# EasyEDA Pro project 前端输入.eprj

# Schematic Schematic1
Board Name: Board1; Create Date: 2026-07-05; Page Name: P1; Project Name: 前端输入; Schematic Name: Schematic1; Update Date: 2026-07-07; Company: 嘉立创EDA; Page Size: A4; Version: V1.0
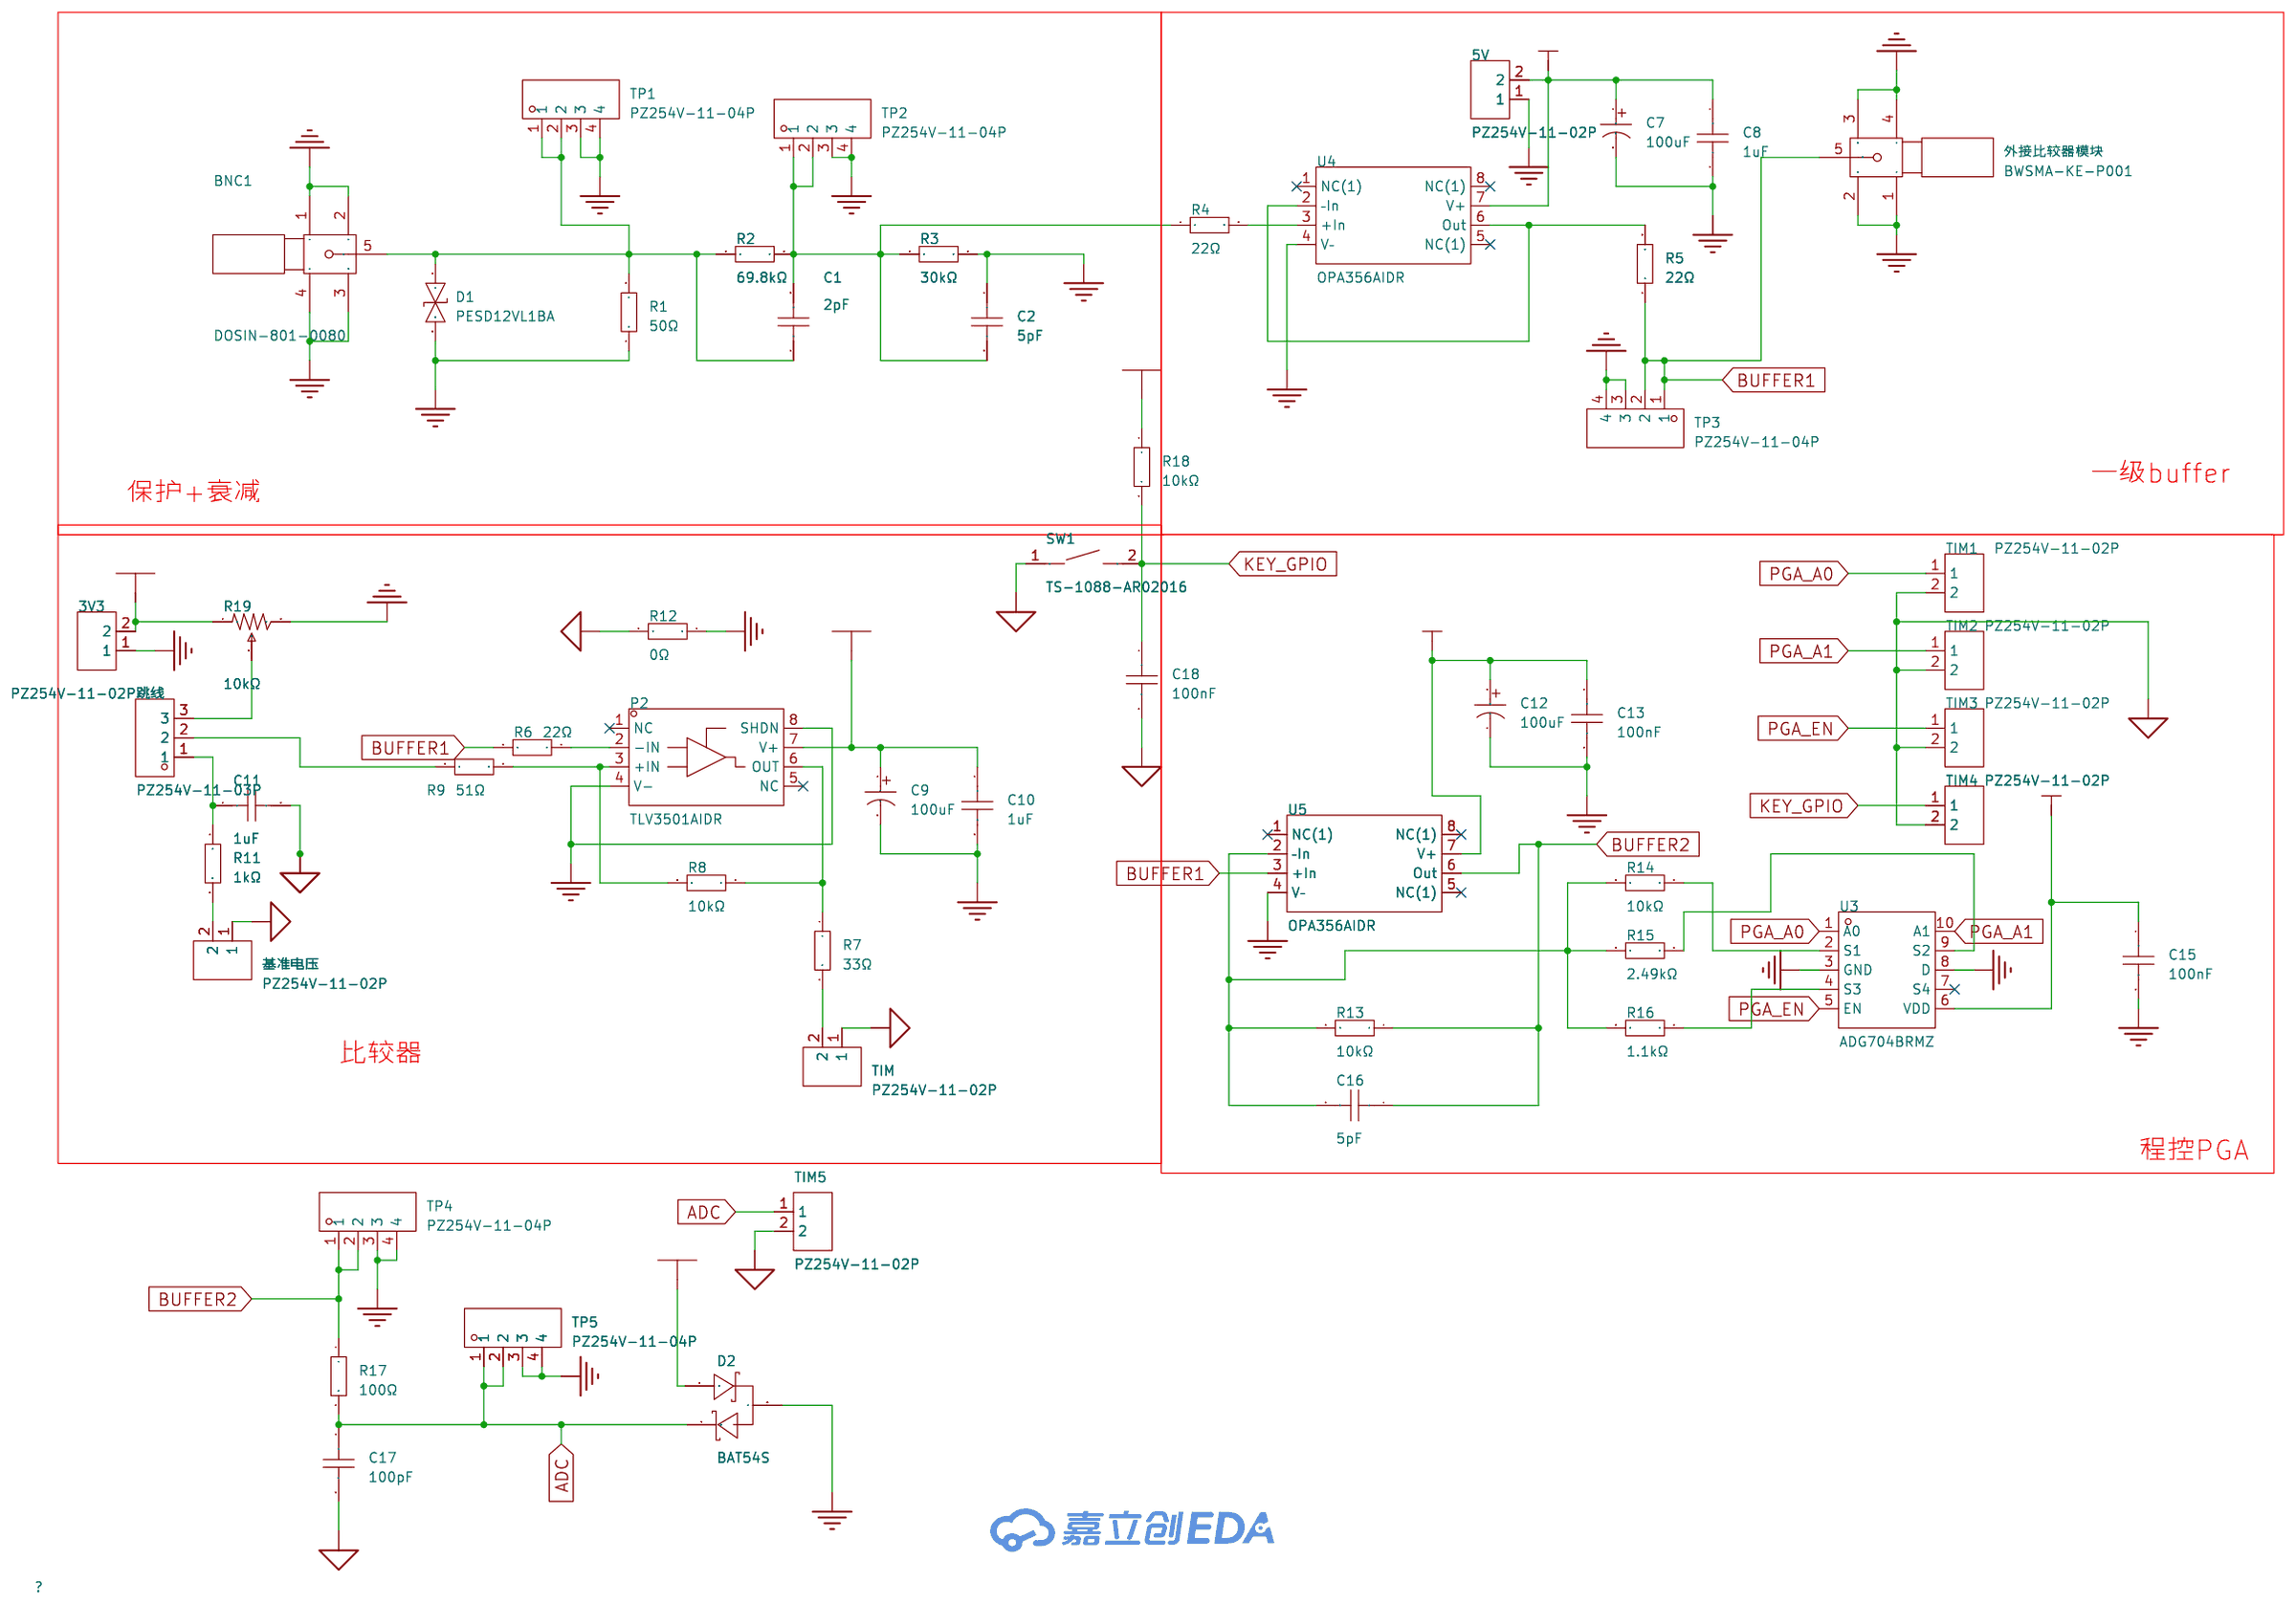
[diagram p0: schematic sheet]

## Parts
3V3  PZ254V-11-02P  [HDR-TH_2P-P2.54-V-M]
5V  PZ254V-11-02P  [HDR-TH_2P-P2.54-V-M]
BNC1  DOSIN-801-0080  [BNC-TH_DOSIN-801-0080]
C1  2pF  [C0603]
C2  5pF  [C0603]
C7  100uF  [CAP-TH_BD6.3-P2.50-D1.0-FD]
C8  1uF  [C0805]
C9  100uF  [CAP-TH_BD6.3-P2.50-D1.0-FD]
C10  1uF  [C0805]
C11  1uF  [C0805]
C12  100uF  [CAP-TH_BD6.3-P2.50-D1.0-FD]
C13  100nF  [C0603]
C15  100nF  [C0603]
C16  5pF  [C0603]
C17  100pF  [C0603]
C18  100nF  [C0603]
D1  PESD12VL1BA  [SOD-323_L1.8-W1.3-LS2.5-BI]
D2  BAT54S  [SOT-23-3_L2.9-W1.3-P1.90-LS2.4-BR]
P2  TLV3501AIDR  [SOP-8_L4.9-W3.9-P1.27-LS6.0-BL]
R1  50Ω  [R0805]
R2  69.8kΩ  [R0603]
R3  30kΩ  [R0805]
R4  22Ω  [R0805]
R5  22Ω  [R0805]
R6  22Ω  [R0805]
R7  33Ω  [R0805]
R8  10kΩ  [R0805]
R9  51Ω  [R0805]
R11  1kΩ  [R0805]
R12  0Ω  [R0805]
R13  10kΩ  [R0603]
R14  10kΩ  [R0603]
R15  2.49kΩ  [R0603]
R16  1.1kΩ  [R0603]
R17  100Ω  [R0805]
R18  10kΩ  [R0805]
R19  10kΩ  [RES-ADJ-TH_3296W]
SW1  TS-1088-AR02016  [SW-SMD_L3.9-W3.0-P4.45]
TIM  PZ254V-11-02P  [HDR-TH_2P-P2.54-V-M]
TIM1  PZ254V-11-02P  [HDR-TH_2P-P2.54-V-M]
TIM2  PZ254V-11-02P  [HDR-TH_2P-P2.54-V-M]
TIM3  PZ254V-11-02P  [HDR-TH_2P-P2.54-V-M]
TIM4  PZ254V-11-02P  [HDR-TH_2P-P2.54-V-M]
TIM5  PZ254V-11-02P  [HDR-TH_2P-P2.54-V-M]
TP1  PZ254V-11-04P  [HDR-TH_4P-P2.54-V-M]
TP2  PZ254V-11-04P  [HDR-TH_4P-P2.54-V-M]
TP3  PZ254V-11-04P  [HDR-TH_4P-P2.54-V-M]
TP4  PZ254V-11-04P  [HDR-TH_4P-P2.54-V-M]
TP5  PZ254V-11-04P  [HDR-TH_4P-P2.54-V-M]
U3  ADG704BRMZ  [MSOP-10_L3.0-W3.0-P0.50-LS5.0-BL]
U4  OPA356AIDR  [SOIC-8_L4.9-W3.9-P1.27-LS6.0-BL]
U5  OPA356AIDR  [SOIC-8_L4.9-W3.9-P1.27-LS6.0-BL]
基准电压  PZ254V-11-02P  [HDR-TH_2P-P2.54-V-M]
外接比较器模块  BWSMA-KE-P001  [SMA-SMD_BWSMA-KE-P001]
跳线  PZ254V-11-03P  [HDR-TH_3P-P2.54-V-M]

## Library data of the parts
3V3 5V TIM TIM1-TIM5 基准电压 = PZ254V-11-02P: 插针结构:1x2P;间距:2.54mm;行距:-;圆针/方针:方针;安装方式:直插;排数:单排;总PIN位数:2P;额定电流:-;额定电压:-;配合针长度:6mm;塑高:2.5mm;端接针长度:3mm;触头材质:黄铜;触头镀层:-;工作温度:-40℃~+105℃;颜色:黑色;; LCSC Part Name: 1x2P 间距:2.54mm 方针 直插; Supplier Part: C492401; Manufacturer: XFCN(兴飞); Supplier Footprint: 插件,P=2.54mm; JLCPCB Part Class: Extended Part; Datasheet: https://item.szlcsc.com/datasheet/PZ254V-11-02P/502957.html; Supplier: LCSC; Pin Structure: 1x2P; Pitch: 2.54mm; Circluar Pins/Square Pins: 方针; Mounting Type: 直插; Number of Rows: 单排; Number of Pins: 2P; Length of Mating Pin: 6mm; Insulation Height: 2.5mm; Length of End Connection Pin: 3mm; Contact Material: 黄铜; Operating Temperature: -40℃~+105℃; Color: 黑色
BNC1 = DOSIN-801-0080: LCSC Part Name: BNC 弯头 三件套; Supplier Part: C521219; Manufacturer: dosinconn(德索五金); Supplier Footprint: 插件; JLCPCB Part Class: Extended Part; Datasheet: https://atta.szlcsc.com/upload/public/pdf/source/20200430/C521219_5C4E877D51B90C03551900B0F93D68EB.pdf; Supplier: LCSC; Connector Type: 板端; RF Series: BNC; Number of Ports: 1; Impedance: 50Ω; Frequency-Max: 3GHz; Style: 弯头; Interface Diameter: 9.6mm; Operating Temperature Range: -55℃~+155℃
C1 = CC0603BRNPO9BN2R0: LCSC Part Name: 2pF 50V ±0.1pF; Supplier Part: C513620; Manufacturer: YAGEO(国巨); Supplier Footprint: 0603; JLCPCB Part Class: Extended Part; Datasheet: https://atta.szlcsc.com/upload/public/pdf/source/20200415/C513620_0748197A58AC495A6AB94E162B9F264B.pdf; Supplier: LCSC; Voltage Rated: 50V; Temperature Coefficient: NP0
C2 C16 = FCC0603N5R0C500CT: LCSC Part Name: ±0.25pF 5pF 50V; Supplier Part: C5137626; Manufacturer: FOJAN(富捷); Supplier Footprint: 0603; JLCPCB Part Class: Extended Part; Datasheet: https://item.szlcsc.com/datasheet/FCC0603N5R0C500CT/5747078.html; Supplier: LCSC; Voltage Rating: 50V; Temperature Coefficient: C0G
C7 C9 C12 = SPZ1EM101E08O00RAXXX: 类型:-;容值:100uF;精度:±20%;额定电压:25V;电容体直径:6.3mm;电容体长度:8mm;脚间距:2.5mm;纹波电流:2.2A@100kHz;等效串联电阻:30mΩ@100kHz;工作寿命:2000hrs@105℃;工作温度:-55℃~+105℃;; LCSC Part Name: 100uF ±20% 25V; Supplier Part: C119026; Manufacturer: AISHI(艾华集团); Supplier Footprint: 径向引线,6.3x8mm; JLCPCB Part Class: Extended Part; Datasheet: https://atta.szlcsc.com/upload/public/pdf/source/20170721/C119026_1500619271504834027.pdf; Supplier: LCSC; Tolerance: ±20%; Rated Voltage: 25V; φD: 6.3mm; L: 8mm; Lead Spacing: 2.5mm; Ripple Current: 2.2A@100kHz; Equivalent Series Resistance(ESR): 30mΩ@100kHz; Lifetime @ Temp: 2000hrs@105℃; Operating Temperature: -55℃~+105℃
C8 C10 C11 = CL21B105KBFNNNE: LCSC Part Name: 1uF ±10% 50V; Supplier Part: C28323; Manufacturer: SAMSUNG(三星); Supplier Footprint: 0805; JLCPCB Part Class: Basic Part; Datasheet: https://item.szlcsc.com/datasheet/CL21B105KBFNNNE/29074.html; Supplier: LCSC; Tolerance: ±10%; Voltage Rating: 50V; Temperature Coefficient: X7R
C13 C15 C18 = CC0603KRX7R9BB104: LCSC Part Name: 100nF ±10% 50V; Supplier Part: C14663; Manufacturer: YAGEO(国巨); Supplier Footprint: 0603; JLCPCB Part Class: Basic Part; Datasheet: https://item.szlcsc.com/datasheet/CC0603KRX7R9BB104/15331.html; Supplier: LCSC; Tolerance: ±10%; Voltage Rating: 50V; Temperature Coefficient: X7R
C17 = CL10C101JB8NNNC: LCSC Part Name: 100pF ±5% 50V; Supplier Part: C14858; Manufacturer: SAMSUNG(三星); Supplier Footprint: 0603; JLCPCB Part Class: Basic Part; Datasheet: https://item.szlcsc.com/datasheet/CL10C101JB8NNNC/15530.html; Supplier: LCSC; Tolerance: ±5%; Voltage Rating: 50V; Temperature Coefficient: C0G
D1 = PESD12VL1BA: LCSC Part Name: ESD二极管 PESD12VL1BA; Supplier Part: C323796; Supplier Footprint: SOD-323; JLCPCB Part Class: Extended Part; Datasheet: https://atta.szlcsc.com/upload/public/pdf/source/20181106/C323796_786395A6D23F4A10D2996BFA6C9A4EF4.pdf; Supplier: LCSC
D2 = BAT54S_C7420333: LCSC Part Name: 电压:30V 电流:200mA; Supplier Part: C7420333; Manufacturer: R+O(宏嘉诚); Supplier Footprint: SOT-23; JLCPCB Part Class: 扩展库; Datasheet: https://item.szlcsc.com/datasheet/BAT54S/8397155.html; Supplier: LCSC; Diode Configuration: 1对串联式; Voltage - Forward(Vf@If): 400mV@10mA; Voltage - DC Reverse(Vr): 30V; Current - Rectified: 200mA; Reverse Leakage Current (Ir): 2uA@30V; Non-Repetitive Peak Forward Surge Current: 600mA
P2 = TLV3501AIDR: 比较器数:单路;输入失调电压(Vos):1mV;输入偏置电流(Ib):2pA;轨到轨:轨到轨输入,轨到轨输出;; LCSC Part Name: 4.5纳秒轨到轨高速比较器在微小封装中; Supplier Part: C43484; Manufacturer: TI(德州仪器); Supplier Footprint: SOP-8; JLCPCB Part Class: 扩展库; Datasheet: https://www.ti.com/cn/lit/gpn/tlv3501; Supplier: LCSC; Number of Channels: 单路; Vos - Input Offset Voltage: 1mV; Ib - Input Bias Current: 2pA; Propagation Delay Time: 4.5ns; Input Hysteresis Voltage (Vhys): 6mV; Output Type: TTL；CMOS; Rail to Rail: 轨到轨输入,轨到轨输出; Quiescent Current: 3.2mA; Operating Temperature: -40℃~+125℃
R1 = ARG05FTC0500: LCSC Part Name: 薄膜电阻 50Ω ±1% 125mW; Supplier Part: C2828866; Manufacturer: Viking(光颉); Supplier Footprint: 0805; JLCPCB Part Class: Extended Part; Datasheet: https://atta.szlcsc.com/upload/public/pdf/source/20211009/C2828883_CAE7D170B8B230FC4A048BDC7B3A81FC.pdf; Supplier: LCSC; Type: 薄膜电阻; Tolerance: ±1%; Power(Watts): 125mW; Overload Voltage (Max): 150V; Temperature Coefficient: ±25ppm/℃; Operating Temperature Range: -55℃~+155℃
R2 = FRC0603F6982TS: LCSC Part Name: 69.8kΩ ±1% 100mW 厚膜电阻; Supplier Part: C2930012; Manufacturer: FOJAN(富捷); Supplier Footprint: 0603; JLCPCB Part Class: Extended Part; Supplier: LCSC; Type: 厚膜电阻; Tolerance: ±1%; Power(Watts): 100mW; Voltage-Supply(Max): 75V; Temperature Coefficient: ±100ppm/℃; Operating Temperature: -55℃~+155℃
R3 = 0805W8F3002T5E: LCSC Part Name: 30kΩ ±1% 125mW 厚膜电阻; Supplier Part: C17621; Manufacturer: UNI-ROYAL(厚声); Supplier Footprint: 0805; JLCPCB Part Class: Basic Part; Datasheet: https://item.szlcsc.com/datasheet/0805W8F3002T5E/18309.html; Supplier: LCSC; Type: 厚膜电阻; Tolerance: ±1%; Power(Watts): 125mW; Voltage-Supply(Max): 150V; Temperature Coefficient: ±100ppm/℃; Operating Temperature: -55℃~+155℃
R4-R6 = 0805W8F220JT5E: LCSC Part Name: 22Ω ±1% 125mW 厚膜电阻; Supplier Part: C17561; Manufacturer: UNI-ROYAL(厚声); Supplier Footprint: 0805; JLCPCB Part Class: Basic Part; Datasheet: https://item.szlcsc.com/datasheet/0805W8F220JT5E/18249.html; Supplier: LCSC; Type: 厚膜电阻; Tolerance: ±1%; Power(Watts): 125mW; Voltage-Supply(Max): 150V; Temperature Coefficient: ±100ppm/℃; Operating Temperature: -55℃~+155℃
R7 = 0805W8F330JT5E: LCSC Part Name: 33Ω ±1% 125mW 厚膜电阻; Supplier Part: C17634; Manufacturer: UNI-ROYAL(厚声); Supplier Footprint: 0805; JLCPCB Part Class: Basic Part; Datasheet: https://item.szlcsc.com/datasheet/0805W8F330JT5E/18322.html; Supplier: LCSC; Type: 厚膜电阻; Tolerance: ±1%; Power(Watts): 125mW; Voltage-Supply(Max): 150V; Temperature Coefficient: ±200ppm/℃; Operating Temperature: -55℃~+155℃
R8 R18 = 0805W8F1002T5E_C17414: LCSC Part Name: 10kΩ ±1% 125mW 厚膜电阻; Supplier Part: C17414; Manufacturer: UNI-ROYAL(厚声); Manufacturer Part: 0805W8F1002T5E; Supplier Footprint: 0805; JLCPCB Part Class: Basic Part; Datasheet: https://item.szlcsc.com/datasheet/0805W8F1002T5E/18102.html; Supplier: LCSC; Type: 厚膜电阻; Tolerance: ±1%; Power(Watts): 125mW; Voltage-Supply(Max): 150V; Temperature Coefficient: ±100ppm/℃; Operating Temperature: -55℃~+155℃
R9 = 0805W8F510JT5E: LCSC Part Name: 51Ω ±1% 125mW 厚膜电阻; Supplier Part: C17738; Manufacturer: UNI-ROYAL(厚声); Supplier Footprint: 0805; JLCPCB Part Class: Basic Part; Datasheet: https://item.szlcsc.com/datasheet/0805W8F510JT5E/18426.html; Supplier: LCSC; Type: 厚膜电阻; Tolerance: ±1%; Power(Watts): 125mW; Voltage-Supply(Max): 150V; Temperature Coefficient: ±100ppm/℃; Operating Temperature: -55℃~+155℃
R11 = 0805W8F1001T5E: LCSC Part Name: 1kΩ ±1% 125mW 厚膜电阻; Supplier Part: C17513; Manufacturer: UNI-ROYAL(厚声); Supplier Footprint: 0805; JLCPCB Part Class: Basic Part; Datasheet: https://atta.szlcsc.com/upload/public/pdf/source/20200306/C422600_1E6D84923E4A46A82E41ADD87F860B5C.pdf; Supplier: LCSC; Type: 厚膜电阻; Tolerance: ±1%; Power(Watts): 125mW; Overload Voltage (Max): 150V; Temperature Coefficient: ±100ppm/℃; Operating Temperature Range: -55℃~+155℃
R12 = 0805W8F0000T5E: LCSC Part Name: 0Ω ±1% 125mW 厚膜电阻; Supplier Part: C17477; Manufacturer: UNI-ROYAL(厚声); Supplier Footprint: 0805; JLCPCB Part Class: Basic Part; Datasheet: https://item.szlcsc.com/datasheet/0805W8F0000T5E/18165.html; Supplier: LCSC; Type: 厚膜电阻; Tolerance: ±1%; Power(Watts): 125mW; Voltage-Supply(Max): 150V; Temperature Coefficient: ±800ppm/℃; Operating Temperature: -55℃~+155℃
R13 R14 = RT0603BRD0710KL: LCSC Part Name: 薄膜电阻 10kΩ ±0.1% 100mW; Supplier Part: C95204; Manufacturer: YAGEO(国巨); Supplier Footprint: 0603; JLCPCB Part Class: Extended Part; Datasheet: https://item.szlcsc.com/datasheet/RT0603BRD0710KL/96405.html; Supplier: LCSC; Type: 薄膜电阻; Tolerance: ±0.1%; Power(Watts): 100mW; Voltage-Supply(Max): 75V; Temperature Coefficient: ±25ppm/℃; Operating Temperature: -55℃~+155℃
R15 = RT0603BRE072K49L: LCSC Part Name: 薄膜电阻 2.49kΩ ±0.1% 100mW; Supplier Part: C705842; Manufacturer: YAGEO(国巨); Supplier Footprint: 0603; JLCPCB Part Class: Extended Part; Datasheet: https://item.szlcsc.com/datasheet/RT0603BRE072K49L/742362.html; Supplier: LCSC; Type: 薄膜电阻; Tolerance: ±0.1%; Power(Watts): 100mW; Voltage-Supply(Max): 75V; Temperature Coefficient: ±50ppm/℃; Operating Temperature: -55℃~+155℃
R16 = ERA3AEB112V: LCSC Part Name: 1.1kΩ ±0.1% 100mW 薄膜电阻; Supplier Part: C543640; Manufacturer: PANASONIC(松下); Supplier Footprint: 0603; JLCPCB Part Class: Extended Part; Datasheet: https://item.szlcsc.com/datasheet/ERA3AEB112V/564276.html; Supplier: LCSC; Type: 薄膜电阻; Tolerance: ±0.1%; Power(Watts): 100mW; Voltage-Supply(Max): 75V; Temperature Coefficient: ±25ppm/℃; Operating Temperature: -55℃~+155℃
R17 = 0805W8F1000T5E: LCSC Part Name: 100Ω ±1% 125mW 厚膜电阻; Supplier Part: C17408; Manufacturer: UNI-ROYAL(厚声); Supplier Footprint: 0805; JLCPCB Part Class: Basic Part; Datasheet: https://atta.szlcsc.com/upload/public/pdf/source/20200306/C422600_1E6D84923E4A46A82E41ADD87F860B5C.pdf; Supplier: LCSC; Type: 厚膜电阻; Tolerance: ±1%; Power(Watts): 125mW; Overload Voltage (Max): 150V; Temperature Coefficient: ±100ppm/℃; Operating Temperature Range: -55℃~+155℃
R19 = 3296W-1-103_C48997937: LCSC Part Name: 玻璃釉预调电位器; Supplier Part: C48997937; Manufacturer: JIERR(捷而瑞); Manufacturer Part: 3296W-1-103; Supplier Footprint: 插件-3P,9.5x4.9mm; JLCPCB Part Class: Extended Part; Datasheet: https://item.szlcsc.com/datasheet/3296W-1-103/51342073.html; Supplier: LCSC; Tolerance: ±10%; Power(Watts): 500mW; Temperature Coefficient: ±250ppm/℃; Number of Turns: 28
SW1 = TS-1088-AR02016: LCSC Part Name: 3.9*3*2mm 立贴 轻触开关; Supplier Part: C720477; Manufacturer: XUNPU(讯普); Supplier Footprint: SMD,4x3mm; JLCPCB Part Class: 基础库; Datasheet: https://item.szlcsc.com/datasheet/TS-1088-AR02016/763484.html; Supplier: LCSC; Circuit: 单刀单掷; Actuator Style: 圆形按钮; Operating Force: 1.6N; Mounting Type: 立贴; Length: 3.9mm; Width: 3mm; Switch Height: 2mm; with Bracket: 不带支架; Contact Current: 50mA; Voltage Rating: 12V; Actuator/Cap Color: 黑色; Termination Style: SMD接片; Life: 10万次; Operating Temperature: -30℃~+80℃
TP1-TP5 = PZ254V-11-04P_C492403: LCSC Part Name: 2.54mm 1x4P 直插 方针; Supplier Part: C492403; Manufacturer: XFCN(兴飞); Supplier Footprint: 插件,P=2.54mm; JLCPCB Part Class: Extended Part; Datasheet: https://atta.szlcsc.com/upload/public/pdf/source/20200309/C492403_F9F19131791D08044AD4F84F8E751A34.pdf; Supplier: LCSC; Pitch: 2.54mm; Number of Pins: 4; Number of Rows: 1; Pin Structure: 1x4P; Mounting Type: 直插; Circluar Pins/Square Pins: 方针; Length of Mating Pin: 6mm; Insulation Height: 2.5mm; Length of End Connection Pin: 3mm; Contact Material: 黄铜; Operating Temperature Range: -40℃~+105℃; Color: 黑色
U3 = ADG704BRMZ: LCSC Part Name: 低电压4欧姆,4通道多路复用器; Supplier Part: C579087; Manufacturer: ADI(亚德诺); Supplier Footprint: MSOP-10; JLCPCB Part Class: 扩展库; Datasheet: https://item.szlcsc.com/datasheet/ADG704BRMZ/606864.html; Supplier: LCSC; Switch Circuit: 4:1; Number of Channels: 1; Ron: 4.5Ω; Voltage - Supply: 1.8V~5.5V; Con: 54pF; Turn-on time: 20ns; Turn-off time: 13ns; Bandwidth: 200MHz; Operating Temperature: -40℃~+85℃; Features: 双向模拟通道；无毛刺切换
U4 U5 = OPA356AIDR: LCSC Part Name: 200MHz, CMOS 运算放大器; Supplier Part: C2059381; Manufacturer: TI(德州仪器); Supplier Footprint: SOIC-8; JLCPCB Part Class: Extended Part; Datasheet: https://www.ti.com/cn/lit/gpn/opa356; Supplier: LCSC; Number of Channels: 1; Maximum Power Supply Range (Vdd-Vss): 5.5V; Rail to Rail: 轨到轨输出; Gain Bandwidth Product: 200MHz; Vos - Input Offset Voltage: 2mV; Input Offset Voltage Drift(Vos TC): 7uV/℃; Slew Rate: 360V/us; Ib - Input Bias Current: 3pA; Input Offset Current(Ios): 1pA; Input Voltage Noise Density: 5.8nV/√Hz@1MHz; Common Mode Rejection Ratio(CMRR): 80dB; Quiescent Current: 8.3mA; Output Current: 60mA; Operating Temperature: -40℃~+125℃; Single supply: 2.5V~5.5V; Dual Supply: -2.75V~-1.25V；1.25V~2.75V; Features: 内置补偿；ESD保护
外接比较器模块 = BWSMA-KE-P001: LCSC Part Name: SMA 内孔 偏脚; Supplier Part: C496550; Manufacturer: BAT WIRELESS(蝙蝠无线); Supplier Footprint: 插件; JLCPCB Part Class: Extended Part; Datasheet: https://atta.szlcsc.com/upload/public/pdf/source/20200416/C496550_06668BF2E3B968EA39F96D17E7156373.pdf; Supplier: LCSC; Connector Type: 板端; RF Series: SMA; Interface Type: 内孔; Number of Ports: 1; Style: 偏脚; Interface Diameter: 5.2mm
跳线 = PZ254V-11-03P: LCSC Part Name: 2.54mm 1x3P 直插 方针; Supplier Part: C492402; Manufacturer: XFCN(兴飞); Supplier Footprint: 插件,P=2.54mm; JLCPCB Part Class: Extended Part; Datasheet: https://atta.szlcsc.com/upload/public/pdf/source/20200309/C492402_8335C3D49C4E4C618838D59BB1D024C1.pdf; Supplier: LCSC; Pitch: 2.54mm; Number of Pins: 3; Number of Rows: 1; Pin Structure: 1x3P; Mounting Type: 直插; Circluar Pins/Square Pins: 方针; Length of Mating Pin: 6mm; Insulation Height: 2.5mm; Length of End Connection Pin: 3mm; Contact Material: 黄铜; Operating Temperature Range: -40℃~+105℃; Color: 黑色

## Nets
3V3: 3V3.2 C9.1 C10.1 D2.1(K1) P2.7(V+) R18.1 R19.1
5V: 5V.2 C7.1 C8.1 C12.1 C13.1 C15.1 U3.6(VDD) U4.7(V+) U5.7(V+)
AGND: C11.2 C17.2 C18.2 R12.2 SW1.1 TIM.1 TIM1.2 TIM2.2 TIM3.2 TIM4.2 TIM5.2 基准电压.1
GND: 3V3.1 5V.1 BNC1.1 BNC1.2 BNC1.3 BNC1.4 C2.1 C7.2 C8.2 C9.2 C10.2 C12.2 C13.2 C15.2 D1.2 D2.3(A) P2.4(V-) P2.8(SHDN) R1.1 R3.2 R12.1 R19.3 TP1.3 TP1.4 TP2.3 TP2.4 TP3.3 TP3.4 TP4.3 TP4.4 TP5.3 TP5.4 U3.3(GND) U3.8(D) U4.4(V–) U5.4(V–) 外接比较器模块.1 外接比较器模块.2 外接比较器模块.3 外接比较器模块.4
ADC: C17.1 D2.2(K2) R17.2 TIM5.1 TP5.1 TP5.2
BUFFER1: R5.1 R6.2 TP3.1 TP3.2 U5.3(+In) 外接比较器模块.5
BUFFER2: C16.1 R13.1 R17.1 TP4.1 TP4.2 U5.6(Out)
KEY_GPIO: C18.1 R18.2 SW1.2 TIM4.1
PGA_A0: TIM1.1 U3.1(A0)
PGA_A1: TIM2.1 U3.10(A1)
PGA_EN: TIM3.1 U3.5(EN)
$1N2258: C1.2 C2.2 R2.2 R3.1 R4.1 TP2.1 TP2.2
$1N4594: P2.3(+IN) R8.2 R9.1
$1N4635: P2.6(OUT) R7.1 R8.1
$1N5116: C11.1 R11.1 跳线.1
$1N6310: P2.2(-IN) R6.1
$1N6327: R9.2 跳线.2
$1N8165: R14.1 U3.2(S1)
$1N8172: R15.1 U3.9(S2)
$1N8199: R16.1 U3.4(S3)
$1N9121: R11.2 基准电压.2
$1N9130: R7.2 TIM.2
$1N11665: R19.2 跳线.3
$1N12270: R5.2 U4.2(–In) U4.6(Out)
$1N12278: R4.2 U4.3(+In)
$1N12297: C16.2 R13.2 R14.2 R15.2 R16.2 U5.2(–In)
$1N12501: BNC1.5 C1.1 D1.1 R1.2 R2.1 TP1.1 TP1.2

Not connected (* = marked no-connect by the designer): P2 1(NC)* 5(NC)*; U3 7(S4)*; U4 1(NC(1))* 5(NC(1))* 8(NC(1))*; U5 1(NC(1))* 5(NC(1))* 8(NC(1))*

## Notes on the sheet
- 一级buffer
- 保护+衰减
- 比较器
- 程控PGA

# Schematic Universal Input Buffer1
Board Name: Board2; Create Date: 2026-07-07; Page Name: P1; Project Name: 前端输入; Schematic Name: Universal Input Buffer1; Update Date: 2026-07-07; Company: 嘉立创EDA; Page Size: A4; Version: V1.0
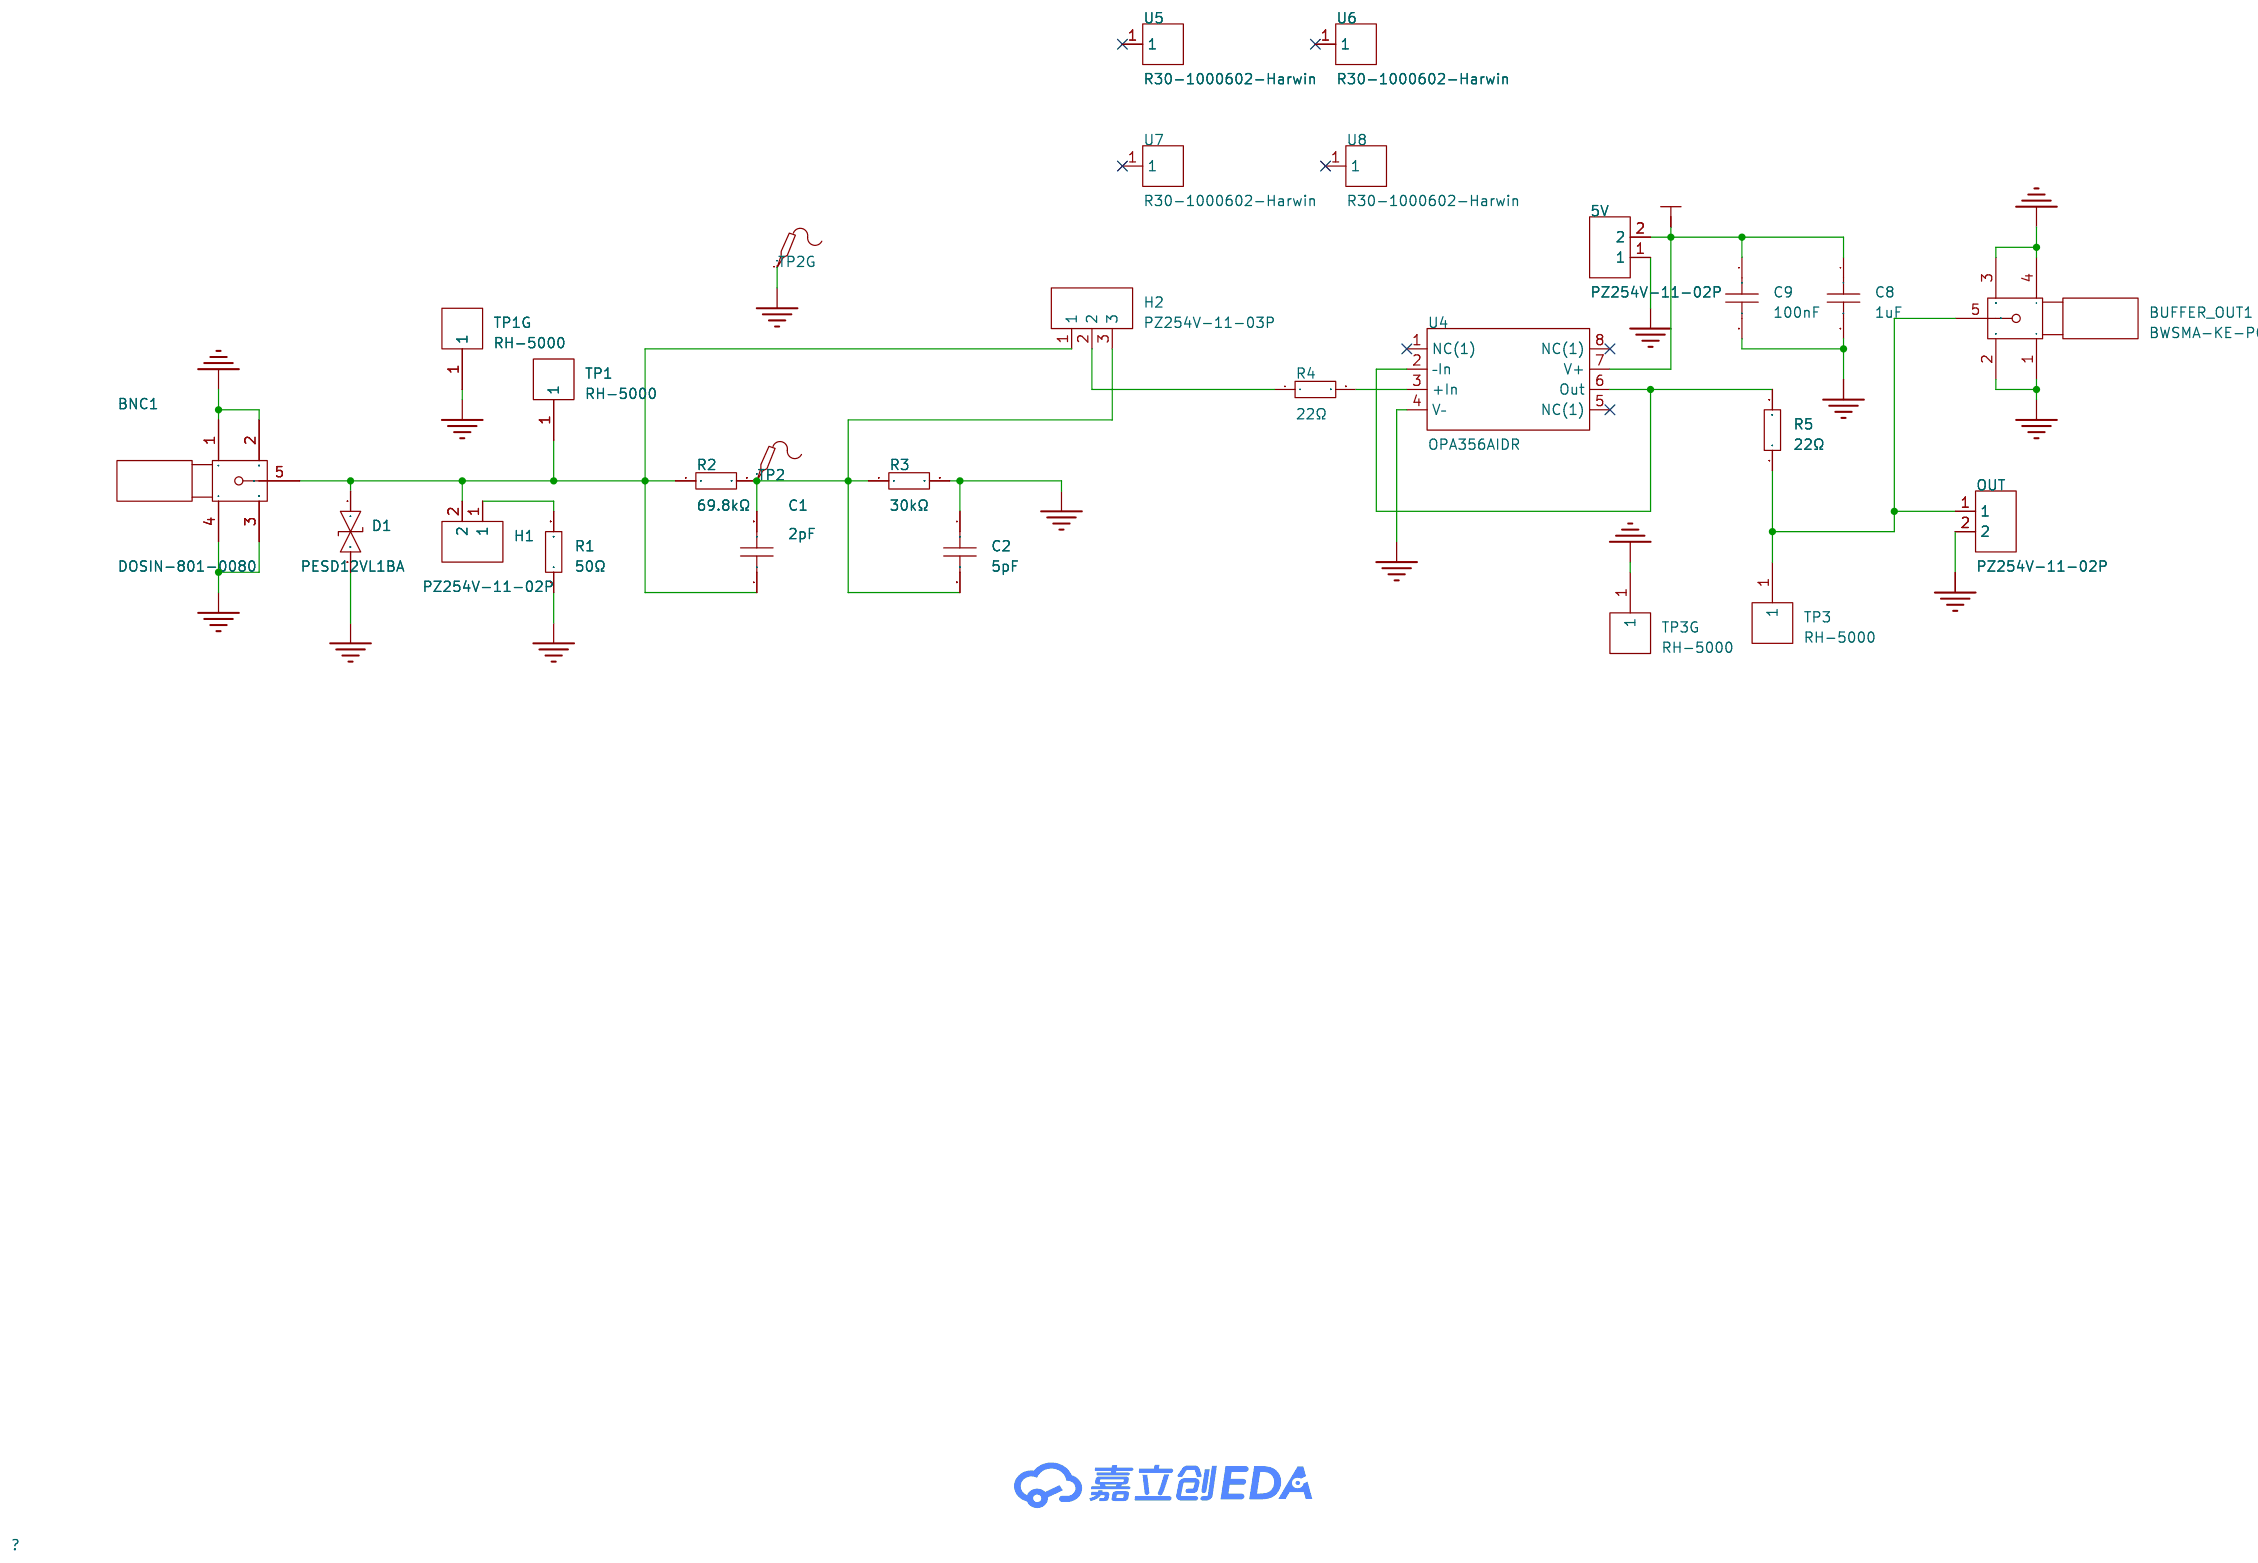
[diagram p1: schematic sheet]

## Parts
5V  PZ254V-11-02P  [HDR-TH_2P-P2.54-V-M]
BNC1  DOSIN-801-0080  [BNC-TH_DOSIN-801-0080]
BUFFER_OUT1  BWSMA-KE-P001  [SMA-SMD_BWSMA-KE-P001]
C1  2pF  [C0603]
C2  5pF  [C0603]
C8  1uF  [C0805]
C9  100nF  [C0805]
D1  PESD12VL1BA  [SOD-323_L1.8-W1.3-LS2.5-BI]
H1  PZ254V-11-02P  [HDR-TH_2P-P2.54-V-M]
H2  PZ254V-11-03P  [HDR-TH_3P-P2.54-V-M_PZ254V-11-03P]
OUT  PZ254V-11-02P  [HDR-TH_2P-P2.54-V-M]
R1  50Ω  [R1206]
R2  69.8kΩ  [R0603]
R3  30kΩ  [R0805]
R4  22Ω  [R0805]
R5  22Ω  [R0805]
TP1  RH-5000  [TEST-TH_BD2.54-P1.4_RED]
TP1G  RH-5000  [TEST-TH_BD2.54-P1.4_RED]
TP2  -  [Test-Point-1.2mm]
TP2G  -  [Test-Point-1.2mm]
TP3  RH-5000  [TEST-TH_BD2.54-P1.4_RED]
TP3G  RH-5000  [TEST-TH_BD2.54-P1.4_RED]
U4  OPA356AIDR  [SOIC-8_L4.9-W3.9-P1.27-LS6.0-BL]
U5  R30-1000602-Harwin  [SMD_BD5.0-D3.0]
U6  R30-1000602-Harwin  [SMD_BD5.0-D3.0]
U7  R30-1000602-Harwin  [SMD_BD5.0-D3.0]
U8  R30-1000602-Harwin  [SMD_BD5.0-D3.0]

## Library data of the parts
5V H1 OUT = PZ254V-11-02P: 插针结构:1x2P;间距:2.54mm;行距:-;圆针/方针:方针;安装方式:直插;排数:单排;总PIN位数:2P;额定电流:-;额定电压:-;配合针长度:6mm;塑高:2.5mm;端接针长度:3mm;触头材质:黄铜;触头镀层:-;工作温度:-40℃~+105℃;颜色:黑色;; LCSC Part Name: 1x2P 间距:2.54mm 方针 直插; Supplier Part: C492401; Manufacturer: XFCN(兴飞); Supplier Footprint: 插件,P=2.54mm; JLCPCB Part Class: Extended Part; Datasheet: https://item.szlcsc.com/datasheet/PZ254V-11-02P/502957.html; Supplier: LCSC; Pin Structure: 1x2P; Pitch: 2.54mm; Circluar Pins/Square Pins: 方针; Mounting Type: 直插; Number of Rows: 单排; Number of Pins: 2P; Length of Mating Pin: 6mm; Insulation Height: 2.5mm; Length of End Connection Pin: 3mm; Contact Material: 黄铜; Operating Temperature: -40℃~+105℃; Color: 黑色
BNC1 = DOSIN-801-0080: LCSC Part Name: BNC 弯头 三件套; Supplier Part: C521219; Manufacturer: dosinconn(德索五金); Supplier Footprint: 插件; JLCPCB Part Class: Extended Part; Datasheet: https://atta.szlcsc.com/upload/public/pdf/source/20200430/C521219_5C4E877D51B90C03551900B0F93D68EB.pdf; Supplier: LCSC; Connector Type: 板端; RF Series: BNC; Number of Ports: 1; Impedance: 50Ω; Frequency-Max: 3GHz; Style: 弯头; Interface Diameter: 9.6mm; Operating Temperature Range: -55℃~+155℃
BUFFER_OUT1 = BWSMA-KE-P001: LCSC Part Name: SMA 内孔 偏脚; Supplier Part: C496550; Manufacturer: BAT WIRELESS(蝙蝠无线); Supplier Footprint: 插件; JLCPCB Part Class: Extended Part; Datasheet: https://atta.szlcsc.com/upload/public/pdf/source/20200416/C496550_06668BF2E3B968EA39F96D17E7156373.pdf; Supplier: LCSC; Connector Type: 板端; RF Series: SMA; Interface Type: 内孔; Number of Ports: 1; Style: 偏脚; Interface Diameter: 5.2mm
C1 = CC0603BRNPO9BN2R0: LCSC Part Name: 2pF 50V ±0.1pF; Supplier Part: C513620; Manufacturer: YAGEO(国巨); Supplier Footprint: 0603; JLCPCB Part Class: Extended Part; Datasheet: https://atta.szlcsc.com/upload/public/pdf/source/20200415/C513620_0748197A58AC495A6AB94E162B9F264B.pdf; Supplier: LCSC; Voltage Rated: 50V; Temperature Coefficient: NP0
C2 = FCC0603N5R0C500CT: LCSC Part Name: ±0.25pF 5pF 50V; Supplier Part: C5137626; Manufacturer: FOJAN(富捷); Supplier Footprint: 0603; JLCPCB Part Class: Extended Part; Datasheet: https://item.szlcsc.com/datasheet/FCC0603N5R0C500CT/5747078.html; Supplier: LCSC; Voltage Rating: 50V; Temperature Coefficient: C0G
C8 = CL21B105KBFNNNE: LCSC Part Name: 1uF ±10% 50V; Supplier Part: C28323; Manufacturer: SAMSUNG(三星); Supplier Footprint: 0805; JLCPCB Part Class: Basic Part; Datasheet: https://item.szlcsc.com/datasheet/CL21B105KBFNNNE/29074.html; Supplier: LCSC; Tolerance: ±10%; Voltage Rating: 50V; Temperature Coefficient: X7R
C9 = CC0805KRX7R9BB104: LCSC Part Name: 100nF ±10% 50V; Supplier Part: C49678; Manufacturer: YAGEO(国巨); Supplier Footprint: 0805; JLCPCB Part Class: Basic Part; Datasheet: https://item.szlcsc.com/datasheet/CC0805KRX7R9BB104/50686.html; Supplier: LCSC; Tolerance: ±10%; Voltage Rating: 50V; Temperature Coefficient: X7R
D1 = PESD12VL1BA: LCSC Part Name: ESD二极管 PESD12VL1BA; Supplier Part: C323796; Supplier Footprint: SOD-323; JLCPCB Part Class: Extended Part; Datasheet: https://atta.szlcsc.com/upload/public/pdf/source/20181106/C323796_786395A6D23F4A10D2996BFA6C9A4EF4.pdf; Supplier: LCSC
H2 = PZ254V-11-03P: LCSC Part Name: 1x3P 间距:2.54mm 方针 直插; Supplier Part: C2937625; Manufacturer: XFCN(兴飞); Supplier Footprint: 插件,P=2.54mm; JLCPCB Part Class: 扩展库; Datasheet: https://item.szlcsc.com/datasheet/PZ254V-11-03P/3293280.html; Supplier: LCSC; Pin Structure: 1x3P; Pitch: 2.54mm; Circluar Pins/Square Pins: 方针; Mounting Type: 直插; Number of Rows: 单排; Number of Pins: 3P; Current Rating: 3A; Voltage Rating (Max): 250V; Length of Mating Pin: 6mm; Insulation Height: 2.5mm; Length of End Connection Pin: 3mm; Operating Temperature: -40℃~+105℃; Color: 黑色
R1 = ARG06BTC0500: LCSC Part Name: 50Ω ±0.1%; Supplier Part: C5266158; Manufacturer: Viking(光颉); Supplier Footprint: 1206; JLCPCB Part Class: Extended Part; Datasheet: https://item.szlcsc.com/datasheet/ARG06BTC0500/5992007.html; Supplier: LCSC; Type: 薄膜电阻; Tolerance: ±0.1%; Power(Watts): 250mW; Voltage-Supply(Max): 200V; Temperature Coefficient: ±25ppm/℃; Operating Temperature: -55℃~+155℃
R2 = FRC0603F6982TS: LCSC Part Name: 69.8kΩ ±1% 100mW 厚膜电阻; Supplier Part: C2930012; Manufacturer: FOJAN(富捷); Supplier Footprint: 0603; JLCPCB Part Class: Extended Part; Supplier: LCSC; Type: 厚膜电阻; Tolerance: ±1%; Power(Watts): 100mW; Voltage-Supply(Max): 75V; Temperature Coefficient: ±100ppm/℃; Operating Temperature: -55℃~+155℃
R3 = 0805W8F3002T5E: LCSC Part Name: 30kΩ ±1% 125mW 厚膜电阻; Supplier Part: C17621; Manufacturer: UNI-ROYAL(厚声); Supplier Footprint: 0805; JLCPCB Part Class: Basic Part; Datasheet: https://item.szlcsc.com/datasheet/0805W8F3002T5E/18309.html; Supplier: LCSC; Type: 厚膜电阻; Tolerance: ±1%; Power(Watts): 125mW; Voltage-Supply(Max): 150V; Temperature Coefficient: ±100ppm/℃; Operating Temperature: -55℃~+155℃
R4 R5 = 0805W8F220JT5E: LCSC Part Name: 22Ω ±1% 125mW 厚膜电阻; Supplier Part: C17561; Manufacturer: UNI-ROYAL(厚声); Supplier Footprint: 0805; JLCPCB Part Class: Basic Part; Datasheet: https://item.szlcsc.com/datasheet/0805W8F220JT5E/18249.html; Supplier: LCSC; Type: 厚膜电阻; Tolerance: ±1%; Power(Watts): 125mW; Voltage-Supply(Max): 150V; Temperature Coefficient: ±100ppm/℃; Operating Temperature: -55℃~+155℃
TP1 TP1G TP3 TP3G = RH-5000: LCSC Part Name: PCB电路板测试点/测试针; Supplier Part: C5277086; Manufacturer: 荣和; JLCPCB Part Class: 扩展库; Datasheet: https://item.szlcsc.com/datasheet/RH-5000/6009931.html; Supplier: LCSC; Connector Type: 插针型(穿板); Plastic Color: 红色; Board Space (Diameter φ/ Length x Width): 2.5mm
TP2 TP2G = Test-Point
U4 = OPA356AIDR: LCSC Part Name: 200MHz, CMOS 运算放大器; Supplier Part: C2059381; Manufacturer: TI(德州仪器); Supplier Footprint: SOIC-8; JLCPCB Part Class: Extended Part; Datasheet: https://www.ti.com/cn/lit/gpn/opa356; Supplier: LCSC; Number of Channels: 1; Maximum Power Supply Range (Vdd-Vss): 5.5V; Rail to Rail: 轨到轨输出; Gain Bandwidth Product: 200MHz; Vos - Input Offset Voltage: 2mV; Input Offset Voltage Drift(Vos TC): 7uV/℃; Slew Rate: 360V/us; Ib - Input Bias Current: 3pA; Input Offset Current(Ios): 1pA; Input Voltage Noise Density: 5.8nV/√Hz@1MHz; Common Mode Rejection Ratio(CMRR): 80dB; Quiescent Current: 8.3mA; Output Current: 60mA; Operating Temperature: -40℃~+125℃; Single supply: 2.5V~5.5V; Dual Supply: -2.75V~-1.25V；1.25V~2.75V; Features: 内置补偿；ESD保护
U5-U8 = R30-1000602-Harwin: LCSC Part Name: HARWIN M3 x 0.5六角黄铜螺母柱,6mm总长,5mm六角对边, R30-1000602 rs1613559; Supplier Part: C47018769; Manufacturer: Harwin; JLCPCB Part Class: 扩展库; Datasheet: https://item.szlcsc.com/datasheet/R30-1000602-Harwin/49200836.html; Supplier: LCSC

## Nets
5V: 5V.2 C8.1 C9.1 U4.7(V+)
GND: 5V.1 BNC1.1 BNC1.2 BNC1.3 BNC1.4 BUFFER_OUT1.1 BUFFER_OUT1.2 BUFFER_OUT1.3 BUFFER_OUT1.4 C2.1 C8.2 C9.2 D1.2 OUT.2 R1.1 R3.2 TP1G.1 TP2G.1 TP3G.1 U4.4(V–)
$1N1018: BNC1.5 C1.1 D1.1 H1.2 H2.1 R2.1 TP1.1
$1N1042: H1.1 R1.2
$1N1045: BUFFER_OUT1.5 OUT.1 R5.1 TP3.1
$1N1050: R5.2 U4.2(–In) U4.6(Out)
$1N1051: R4.2 U4.3(+In)
$1N1054: C1.2 C2.2 H2.3 R2.2 R3.1 TP2.1
$1N1067: H2.2 R4.1

Not connected (* = marked no-connect by the designer): U4 1(NC(1))* 5(NC(1))* 8(NC(1))*; U5 1*; U6 1*; U7 1*; U8 1*

# Board PCB1
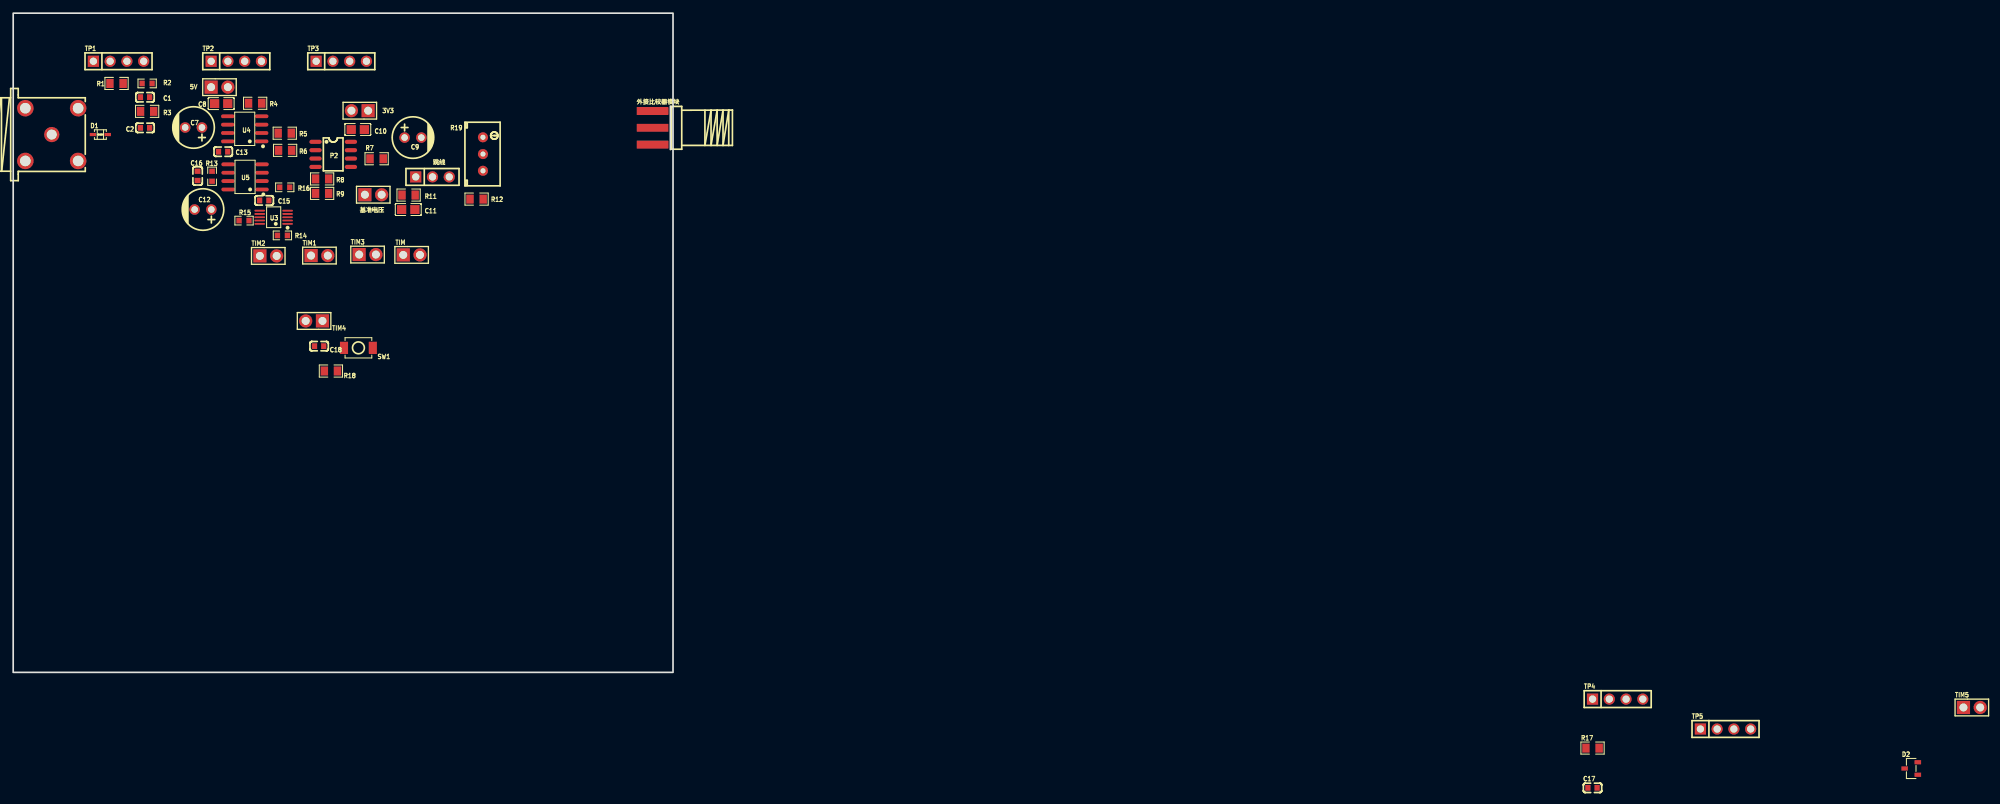
[diagram p2: board, top side]
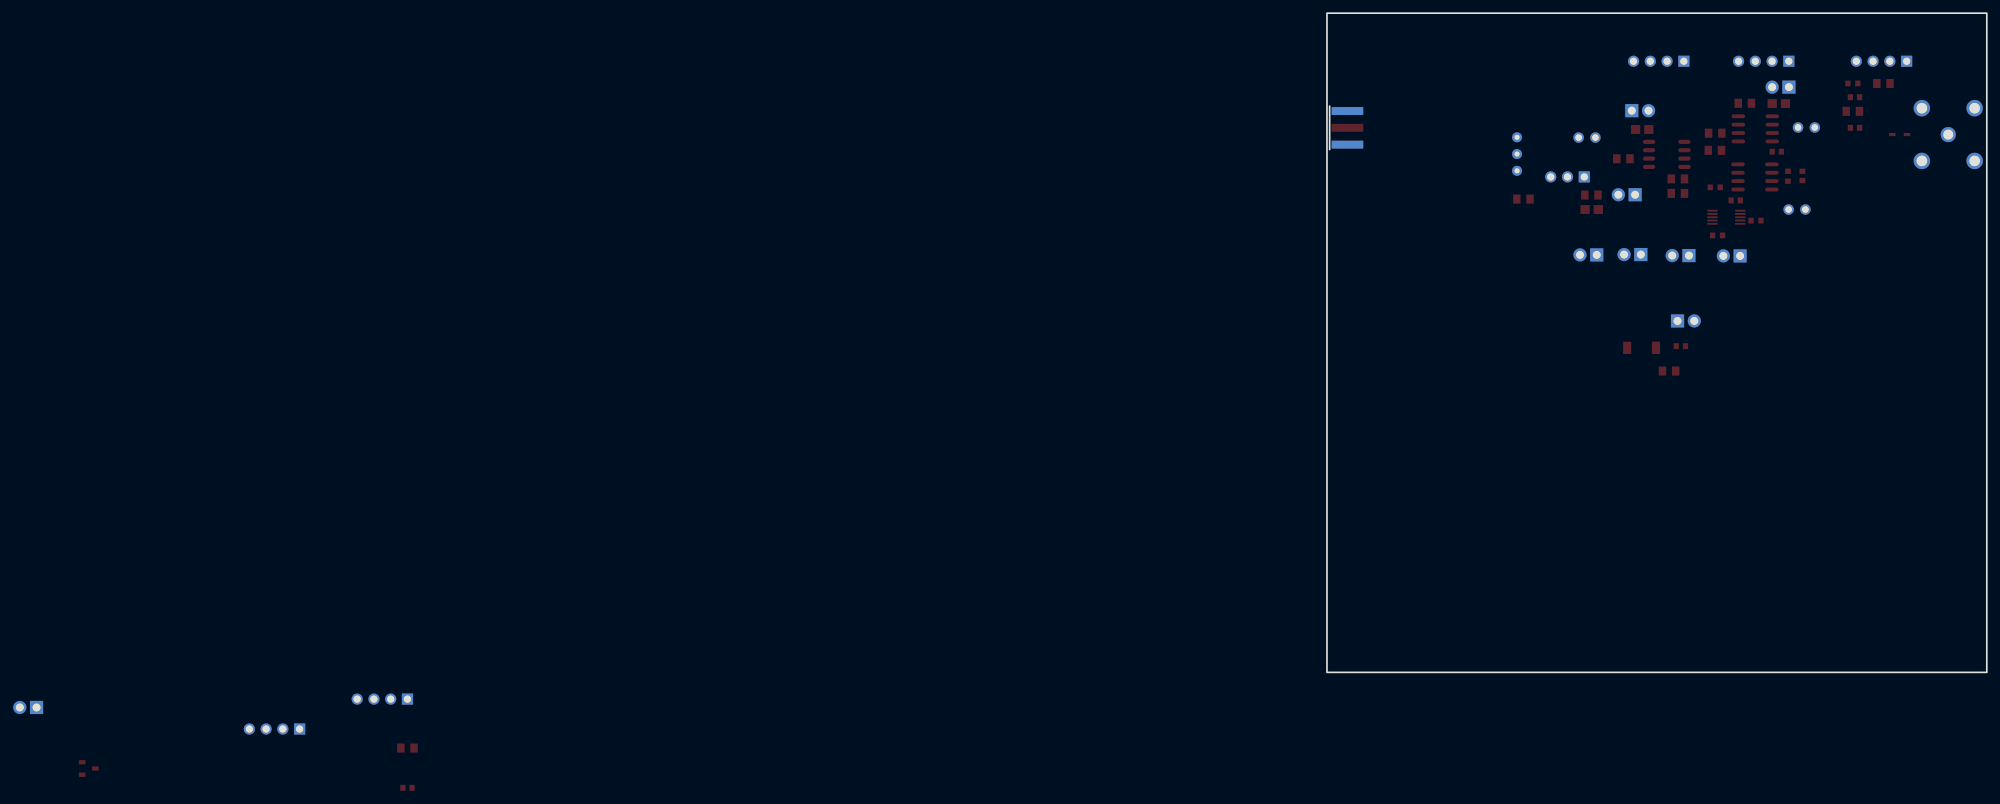
[diagram p3: board, bottom side, seen from below]

Outline 100 x 100 mm; copper layers: Top Layer, Bottom Layer. Coordinates in mm from the lower left corner of the outline.
Outline path: rectangle 0,100 100,0
Stack: Top Layer 0.035mm / Dielectric1 1.51mm FR4 er 4.5 / Bottom Layer 0.035mm

## Design rules (mm)
template: JLCPCB Capability(Two Layers Board)
spacing copperThickness1oz (default): track to track 0.102, other pairs 0.152 to 0.3
spacing copperThickness2oz: track to track 0.203, other pairs 0.152 to 0.3
track width copperThickness1oz (default): min 0.127, default 0.254, max 2.54
track width copperThickness2oz: min 0.203, default 0.254, max 2.54
differential pair differentialPair (default): width min 0.127, default 0.254, max 2.54; gap min 0.152, default 0.152
via viaSize (default): diameter min 0.5, default 0.61, max 10; hole min 0.3, default 0.305, max 6.3

## Placement (name value [footprint] x y rotation side)
3V3  PZ254V-11-02P  [HDR-TH_2P-P2.54-V-M]  52.53 85.21 180 top
5V  PZ254V-11-02P  [HDR-TH_2P-P2.54-V-M]  31.26 88.78 0 top
BNC1  DOSIN-801-0080  [BNC-TH_DOSIN-801-0080]  5.84 81.58 90 top
C1  2pF  [C0603]  19.98 87.25 0 top
C2  5pF  [C0603]  19.98 82.61 0 top
C7  100uF  [CAP-TH_BD6.3-P2.50-D1.0-FD]  27.34 82.66 180 top
C8  1uF  [C0805]  31.52 86.28 180 top
C9  100uF  [CAP-TH_BD6.3-P2.50-D1.0-FD]  60.59 81.13 0 top
C10  1uF  [C0805]  52.22 82.35 0 top
C11  1uF  [C0805]  59.88 70.22 180 top
C12  100uF  [CAP-TH_BD6.3-P2.50-D1.0-FD]  28.76 70.22 180 top
C13  100nF  [C0603]  31.82 78.99 180 top
C15  100nF  [C0603]  38.05 71.59 0 top
C16  5pF  [C0603]  27.95 75.32 270 top
C17  100pF  [C0603]  239.36 -17.52 0 top
C18  100nF  [C0603]  46.37 49.49 180 top
D1  PESD12VL1BA  [SOD-323_L1.8-W1.3-LS2.5-BI]  13.21 81.59 0 top
D2  BAT54S  [SOT-23-3_L2.9-W1.3-P1.90-LS2.4-BR]  287.65 -14.58 0 top
P2  TLV3501AIDR  [SOP-8_L4.9-W3.9-P1.27-LS6.0-BL]  48.5 78.58 270 top
R1  50Ω  [R0805]  15.66 89.34 180 top
R2  69.8kΩ  [R0603]  20.3 89.34 0 top
R3  30kΩ  [R0805]  20.3 85.11 180 top
R4  22Ω  [R0805]  36.67 86.33 0 top
R5  22Ω  [R0805]  41.16 81.79 180 top
R6  22Ω  [R0805]  41.21 79.19 180 top
R7  33Ω  [R0805]  55.08 77.92 0 top
R8  10kΩ  [R0805]  46.82 74.86 180 top
R9  51Ω  [R0805]  46.82 72.66 0 top
R11  1kΩ  [R0805]  59.93 72.41 180 top
R12  0Ω  [R0805]  70.23 71.8 180 top
R13  10kΩ  [R0603]  30.14 75.26 270 top
R14  10kΩ  [R0603]  40.8 66.29 180 top
R15  2.49kΩ  [R0603]  34.99 68.53 180 top
R16  1.1kΩ  [R0603]  41.16 73.58 180 top
R17  100Ω  [R0805]  239.36 -11.48 0 top
R18  10kΩ  [R0805]  48.15 45.71 180 top
R19  10kΩ  [RES-ADJ-TH_3296W]  71.2 78.63 0 top
SW1  TS-1088-AR02016  [SW-SMD_L3.9-W3.0-P4.45]  52.32 49.23 180 top
TIM  PZ254V-11-02P  [HDR-TH_2P-P2.54-V-M]  60.38 63.33 0 top
TIM1  PZ254V-11-02P  [HDR-TH_2P-P2.54-V-M]  46.41 63.23 0 top
TIM2  PZ254V-11-02P  [HDR-TH_2P-P2.54-V-M]  38.66 63.18 0 top
TIM3  PZ254V-11-02P  [HDR-TH_2P-P2.54-V-M]  53.7 63.38 0 top
TIM4  PZ254V-11-02P  [HDR-TH_2P-P2.54-V-M]  45.6 53.31 180 top
TIM5  PZ254V-11-02P  [HDR-TH_2P-P2.54-V-M]  296.84 -5.33 0 top
TP1  PZ254V-11-04P  [HDR-TH_4P-P2.54-V-M]  15.96 92.71 0 top
TP2  PZ254V-11-04P  [HDR-TH_4P-P2.54-V-M]  33.81 92.71 0 top
TP3  PZ254V-11-04P  [HDR-TH_4P-P2.54-V-M]  49.73 92.71 0 top
TP4  PZ254V-11-04P  [HDR-TH_4P-P2.54-V-M]  243.17 -4.06 0 top
TP5  PZ254V-11-04P  [HDR-TH_4P-P2.54-V-M]  259.51 -8.59 0 top
U3  ADG704BRMZ  [MSOP-10_L3.0-W3.0-P0.50-LS5.0-BL]  39.47 69.04 90 top
U4  OPA356AIDR  [SOIC-8_L4.9-W3.9-P1.27-LS6.0-BL]  35.09 82.46 90 top
U5  OPA356AIDR  [SOIC-8_L4.9-W3.9-P1.27-LS6.0-BL]  35.14 75.16 90 top
基准电压  PZ254V-11-02P  [HDR-TH_2P-P2.54-V-M]  54.57 72.46 0 top
外接比较器模块  BWSMA-KE-P001  [SMA-SMD_BWSMA-KE-P001]  96.9 82.61 0 top
跳线  PZ254V-11-03P  [HDR-TH_3P-P2.54-V-M]  63.55 75.16 0 top

## Footprints (pads in the part's own frame, mm; a bottom-side part is the same pattern mirrored in y, then rotated)
BNC-TH_DOSIN-801-0080
  round 2.499 hole 1.6: 1(4,-4) 2(-4,-4) 3(-4,4) 4(4,4)
  round 2.301 hole 1.501: 5(0,0)
C0603
  rect 0.8x0.9 smd: 1(-0.7,0) 2(0.7,0)
C0805
  rect 1.41x1.35 smd: 1(-1,0) 2(1,0)
CAP-TH_BD6.3-P2.50-D1.0-FD
  round 1.6 hole 1: 1(-1.27,0) 2(1.27,0)
HDR-TH_2P-P2.54-V-M
  rect 2x2 hole 1.2: 1(-1.27,0)
  round 2 hole 1.2: 2(1.27,0)
HDR-TH_3P-P2.54-V-M
  rect 1.7x1.7 hole 1.1: 1(-2.54,0)
  round 1.7 hole 1.1: 2(0,0) 3(2.54,0)
HDR-TH_4P-P2.54-V-M
  rect 1.7x1.7 hole 1.1: 1(-3.81,0)
  round 1.7 hole 1.1: 2(-1.27,0) 3(1.27,0) 4(3.81,0)
MSOP-10_L3.0-W3.0-P0.50-LS5.0-BL
  oval 0.28x1.62 smd: 1(-1,-2.11) 2(-0.5,-2.11) 3(0,-2.11) 4(0.5,-2.11) 5(1,-2.11) 6(1,2.11) 7(0.5,2.11) 8(0,2.11) 9(-0.5,2.11) 10(-1,2.11)
R0603
  rect 0.806x0.864 smd: 1(-0.753,0) 2(0.753,0)
R0805
  rect 1.133x1.377 smd: 1(-1,0) 2(1,0)
RES-ADJ-TH_3296W
  round 1.524 hole 0.762: 1(0,2.54) 2(0,0) 3(0,-2.54)
SMA-SMD_BWSMA-KE-P001
  rect 4.8x1.2 smd: 1(0,-2.55) 2(0,2.55) 5(0,0)
  rect 4.8x1.2 smd far side: 3(0,2.55) 4(0,-2.55)
SOD-323_L1.8-W1.3-LS2.5-BI
  rect 0.986x0.49 smd: 1(-1.117,0) 2(1.117,0)
SOIC-8_L4.9-W3.9-P1.27-LS6.0-BL
  oval 0.588x2.045 smd: 1(-1.905,-2.57) 2(-0.635,-2.57) 3(0.635,-2.57) 4(1.905,-2.57) 5(1.905,2.57) 6(0.635,2.57) 7(-0.635,2.57) 8(-1.905,2.57)
SOP-8_L4.9-W3.9-P1.27-LS6.0-BL
  oval 0.63x1.865 smd: 1(-1.905,-2.683) 2(-0.635,-2.683) 3(0.635,-2.683) 4(1.905,-2.683) 5(1.905,2.683) 6(0.635,2.683) 7(-0.635,2.683) 8(-1.905,2.683)
SOT-23-3_L2.9-W1.3-P1.90-LS2.4-BR
  rect 1x0.65 smd: 1(1,-0.95) 2(1,0.95) 3(-1,0)
SW-SMD_L3.9-W3.0-P4.45
  rect 1.23x1.86 smd: 1(-2.185,0) 2(2.185,0)

## Nets
As in the schematic.

Pads without a net: P2 1 5; U3 7; U4 1 5 8; U5 1 5 8

# Board PCB2
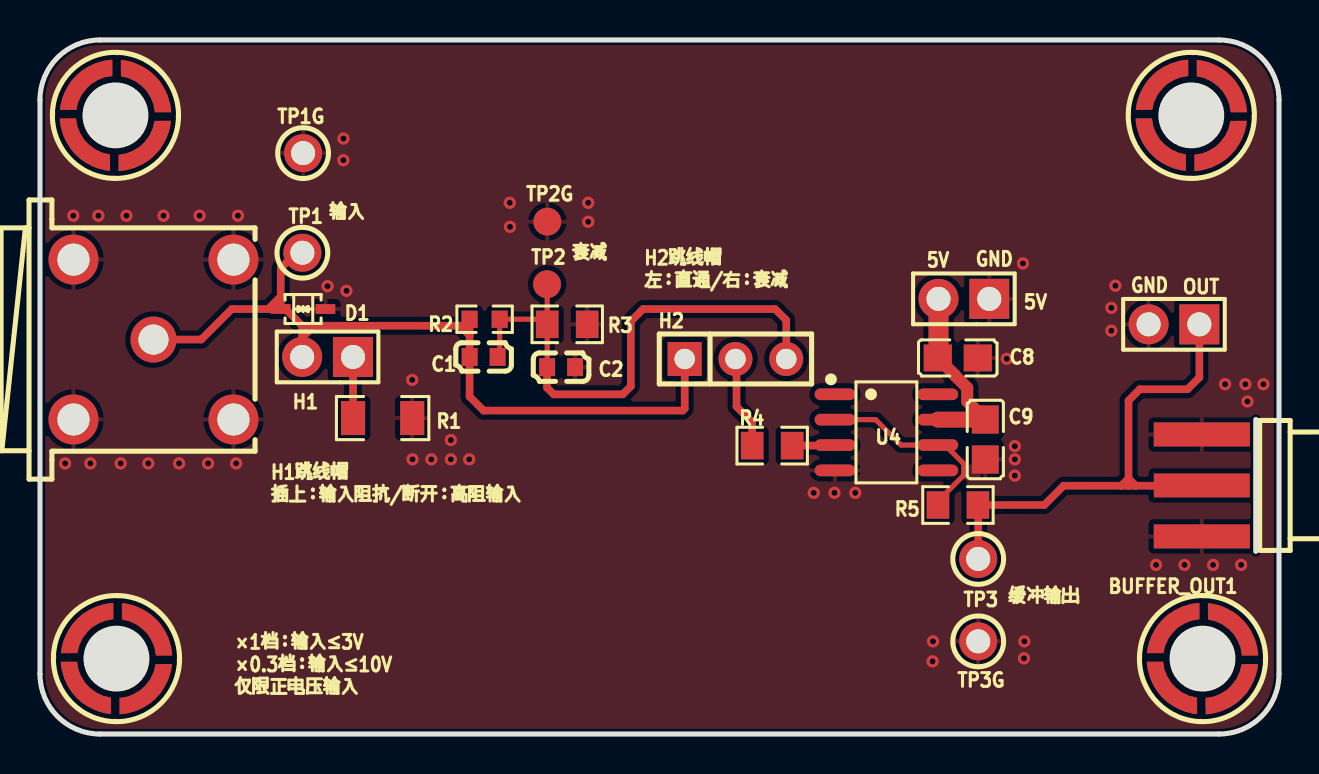
[diagram p4: board, top side]
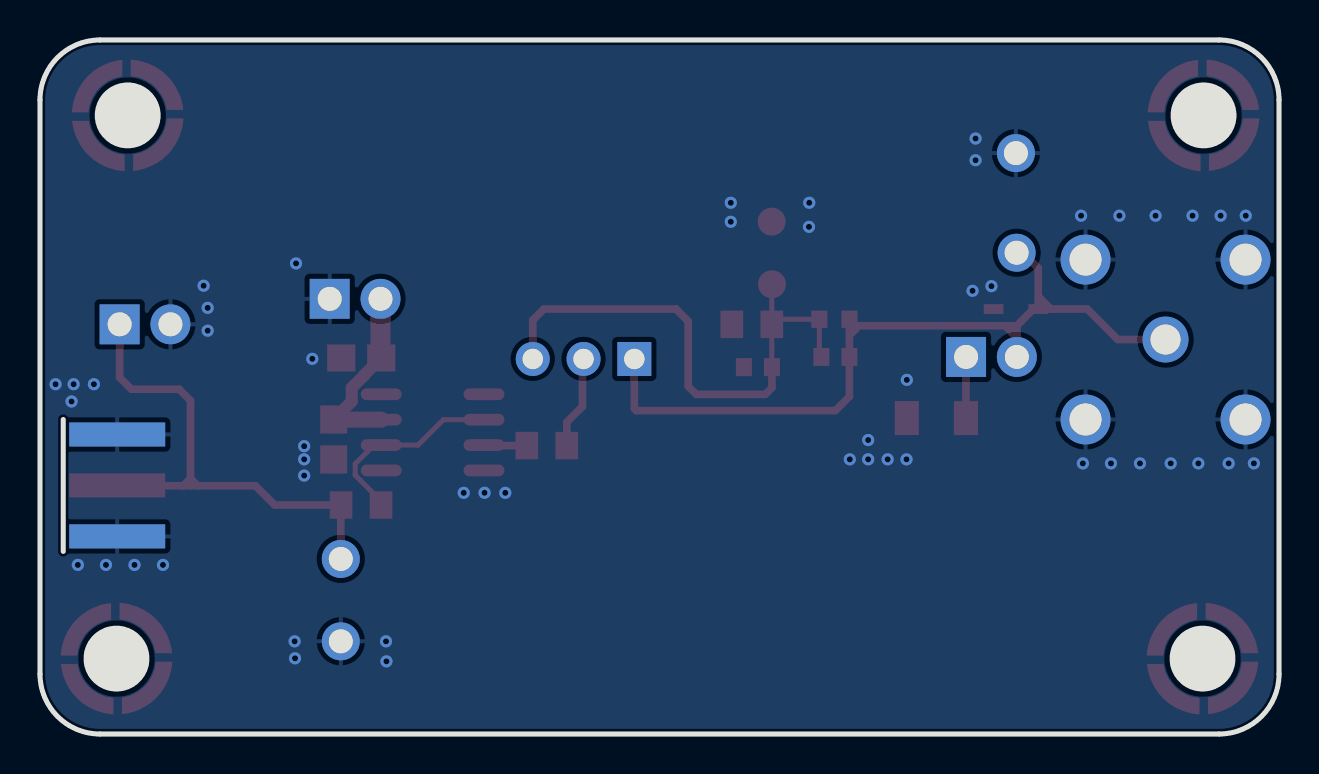
[diagram p5: board, bottom side, seen from below]

Outline 61.97 x 34.73 mm; copper layers: Top Layer, Bottom Layer. Coordinates in mm from the lower left corner of the outline.
Outline path: 0,31.73 0,3 arc(0.88,0.88) 3,0 58.97,0 arc(61.09,0.88) 61.97,3 61.97,31.73 arc(61.09,33.85) 58.97,34.73 3,34.73 arc(0.88,33.85) 0,31.73
Stack: Top Layer 0.035mm / Dielectric1 1.51mm FR4 er 4.5 / Bottom Layer 0.035mm

## Design rules (mm)
template: JLCPCB Capability(Two Layers Board)
spacing copperThickness1oz (default): track to track 0.102, other pairs 0.152 to 0.3
spacing copperThickness2oz: track to track 0.203, other pairs 0.152 to 0.3
track width copperThickness1oz (default): min 0.127, default 0.254, max 2.54
track width copperThickness2oz: min 0.203, default 0.254, max 2.54
differential pair differentialPair (default): width min 0.127, default 0.254, max 2.54; gap min 0.152, default 0.152
via viaSize (default): diameter min 0.5, default 0.61, max 10; hole min 0.3, default 0.305, max 6.3

## Placement (name value [footprint] x y rotation side)
5V  PZ254V-11-02P  [HDR-TH_2P-P2.54-V-M]  46.21 21.78 180 top
BNC1  DOSIN-801-0080  [BNC-TH_DOSIN-801-0080]  5.68 19.74 90 top
BUFFER_OUT1  BWSMA-KE-P001  [SMA-SMD_BWSMA-KE-P001]  58.11 12.44 0 top
C1  2pF  [C0603]  22.19 18.87 0 top
C2  5pF  [C0603]  26.06 18.36 180 top
C8  1uF  [C0805]  45.9 18.82 0 top
C9  100nF  [C0805]  47.28 14.74 270 top
D1  PESD12VL1BA  [SOD-323_L1.8-W1.3-LS2.5-BI]  13.16 21.27 0 top
H1  PZ254V-11-02P  [HDR-TH_2P-P2.54-V-M]  14.38 18.87 180 top
H2  PZ254V-11-03P  [HDR-TH_3P-P2.54-V-M_PZ254V-11-03P]  34.78 18.77 0 top
OUT  PZ254V-11-02P  [HDR-TH_2P-P2.54-V-M]  56.71 20.5 180 top
R1  50Ω  [R1206]  17.14 15.81 180 top
R2  69.8kΩ  [R0603]  22.24 20.76 0 top
R3  30kΩ  [R0805]  26.37 20.5 0 top
R4  22Ω  [R0805]  36.62 14.43 0 top
R5  22Ω  [R0805]  45.91 11.46 180 top
TP1  RH-5000  [TEST-TH_BD2.54-P1.4_RED]  13.12 24.08 0 top
TP1G  RH-5000  [TEST-TH_BD2.54-P1.4_RED]  13.16 29.07 0 top
TP2  -  [Test-Point-1.2mm]  25.36 22.51 0 top
TP2G  -  [Test-Point-1.2mm]  25.37 25.64 0 top
TP3  RH-5000  [TEST-TH_BD2.54-P1.4_RED]  46.92 8.76 0 top
TP3G  RH-5000  [TEST-TH_BD2.54-P1.4_RED]  46.92 4.64 0 top
U4  OPA356AIDR  [SOIC-8_L4.9-W3.9-P1.27-LS6.0-BL]  42.33 15.1 270 top
U5  R30-1000602-Harwin  [SMD_BD5.0-D3.0]  3.77 30.96 0 top
U6  R30-1000602-Harwin  [SMD_BD5.0-D3.0]  3.83 3.77 0 top
U7  R30-1000602-Harwin  [SMD_BD5.0-D3.0]  57.58 30.96 0 top
U8  R30-1000602-Harwin  [SMD_BD5.0-D3.0]  58.14 3.77 0 top

## Footprints (pads in the part's own frame, mm; a bottom-side part is the same pattern mirrored in y, then rotated)
BNC-TH_DOSIN-801-0080
  round 2.499 hole 1.6: 1(4,-4) 2(-4,-4) 3(-4,4) 4(4,4)
  round 2.301 hole 1.501: 5(0,0)
C0603
  rect 0.8x0.9 smd: 1(-0.7,0) 2(0.7,0)
C0805
  rect 1.41x1.35 smd: 1(-1,0) 2(1,0)
HDR-TH_2P-P2.54-V-M
  rect 2x2 hole 1.2: 1(-1.27,0)
  round 2 hole 1.2: 2(1.27,0)
HDR-TH_3P-P2.54-V-M_PZ254V-11-03P
  rect 1.7x1.7 hole 1.02: 1(-2.54,0)
  round 1.7 hole 1.02: 2(0,0) 3(2.54,0)
R0603
  rect 0.806x0.864 smd: 1(-0.753,0) 2(0.753,0)
R0805
  rect 1.133x1.377 smd: 1(-1,0) 2(1,0)
R1206
  rect 1.208x1.701 smd: 1(-1.479,0) 2(1.479,0)
SMA-SMD_BWSMA-KE-P001
  rect 4.8x1.2 smd: 1(0,-2.55) 2(0,2.55) 5(0,0)
  rect 4.8x1.2 smd far side: 3(0,2.55) 4(0,-2.55)
SMD_BD5.0-D3.0
  custom 2.52x2.628 smd: 1(-1.529,-1.792) 1(1.529,1.792)
  custom 2.629x2.52 smd: 1(-1.466,1.847) 1(1.465,-1.847)
SOD-323_L1.8-W1.3-LS2.5-BI
  rect 0.986x0.49 smd: 1(-1.117,0) 2(1.117,0)
SOIC-8_L4.9-W3.9-P1.27-LS6.0-BL
  oval 0.588x2.045 smd: 1(-1.905,-2.57) 2(-0.635,-2.57) 3(0.635,-2.57) 4(1.905,-2.57) 5(1.905,2.57) 6(0.635,2.57) 7(-0.635,2.57) 8(-1.905,2.57)
Test-Point-1.2mm
  round 1.4 smd: 1(0,0)
TEST-TH_BD2.54-P1.4_RED
  round 1.9 hole 1.2: 1(0,0)

## Nets
As in the schematic.

Pads without a net: U4 1 5 8; U5 1; U6 1; U7 1; U8 1

## Via types
v1: diameter 0.61, hole 0.305, Top Layer to Bottom Layer, 50 vias

## Routing (per net, layer and track width the routed paths; a pad name or vN(x,y) marks a point on that pad's centre or on a via; arc(x,y) is an arc through that point)
5V: length 9.4
  Top Layer w0.6: C9.1 46.37,16.64 46.37,17.33 45.74,17.96 45.74,17.98 C8.1
  Top Layer w0.8: C9.1 47.27,15.73 U4.7
  Top Layer w1: C8.1 44.94,18.86 5V.2
GND:
  vias: v1(1.26,13.54) v1(1.66,25.94) v1(2.52,13.54) v1(2.92,25.94) v1(4.03,13.54) v1(4.33,25.94) v1(5.42,13.54) v1(6.18,25.94) v1(6.96,13.54) v1(7.98,25.94) v1(8.41,13.54) v1(9.81,13.54) v1(9.9,25.94) v1(14.38,22.41) v1(15.18,29.8) v1(15.18,28.71) v1(15.33,22.18) v1(18.61,17.72) v1(18.63,13.75) v1(19.57,13.75) v1(20.55,14.71) v1(20.55,13.75) v1(21.47,13.75) v1(23.49,26.58) v1(23.51,25.38) v1(27.42,26.58) v1(27.42,25.63) v1(38.7,12.07) v1(39.73,12.07) v1(40.77,12.07) v1(44.64,3.64) v1(44.66,4.64) v1(48.35,18.78) v1(48.76,14.41) v1(48.76,13.75) v1(48.76,12.93) v1(49.16,23.55) v1(49.23,4.64) v1(49.21,3.79) v1(53.58,21.33) v1(53.58,20.18) v1(53.78,22.43) v1(55.82,8.46) v1(57.24,8.46) v1(58.67,8.46) v1(59.27,17.51) v1(60.07,8.46) v1(60.28,17.51) v1(60.39,16.64) v1(61.19,17.51)
$1N1018: length 41.6
  Top Layer w0.381: 13.11,20.43 12.28,21.27 D1.1 ; 13.11,20.43 13.11,19.92 ; 13.11,20.43 13.7,20.43 ; 11.41,21.27 9.59,21.27 8.06,19.74 BNC1.5 ; 11.41,21.27 11.93,21.79 12.04,21.79 ; 11.41,21.27 D1.1 ; 13.11,19.92 H1.2 ; 13.11,19.92 13.19,19.92 13.7,20.43 ; D1.1 12.04,21.79 ; 21.16,20.43 R2.1 21.49,20.75 21.49,19.95 ; 21.16,20.43 13.7,20.43 ; 21.16,20.43 21.16,20.28 21.49,19.95 ; 12.04,21.79 12.04,23.31 12.81,24.08 TP1.1 ; 21.49,19.95 C1.1 21.49,16.89 22.19,16.18 32.14,16.18 32.24,16.28 H2.1
$1N1042: length 3.1
  Top Layer w0.381: H1.1 15.66,18.86 R1.2
$1N1045: length 26.3
  Top Layer w0.381: 54.44,12.43 54.44,12.79 ; 54.44,12.43 54.8,12.43 ; 54.44,12.43 54.08,12.43 ; 54.44,12.79 54.08,12.43 ; 54.44,12.79 54.8,12.43 ; 54.44,12.79 54.44,16.69 55,17.25 57.39,17.25 57.98,17.84 OUT.1 ; TP3.1 46.92,11.45 R5.1 50.23,11.46 51.19,12.43 54.08,12.43 ; 54.8,12.43 58.09,12.43 BUFFER_OUT1.5
$1N1050: length 10
  Top Layer w0.254: U4.2 41.79,15.73 43.06,14.46 U4.6 45.26,14.46 46.2,13.52 46.2,12.95 44.91,11.66 R5.2
$1N1051: length 2.2
  Top Layer w0.381: U4.3 39.73,14.43 R4.2
$1N1054: length 27.5
  Top Layer w0.254: R3.1 25.37,22.5 TP2.1 ; R3.1 25.11,20.76 R2.2 22.99,18.97 C1.2 ; R3.1 25.37,18.37 C2.2
  Top Layer w0.381: C2.2 25.36,17.33 25.69,17 29.15,17 29.55,17.4 29.55,20.66 30.16,21.27 36.77,21.27 37.32,20.71 H2.3
$1N1067: length 4.7
  Top Layer w0.381: R4.1 35.62,15.6 34.84,16.39 34.84,18.72 H2.2

## Copper pours and planes (outline as drawn; the poured copper is in the pictures)
GND on Top Layer: -3.06,37.37 63.39,37.37 63.39,-2.92 -3.06,-2.92
GND on Bottom Layer: -6.21,40.01 67.7,40.01 67.7,-7.64 -6.21,-7.64

## Text on the board
Top Silkscreen Layer: 5V | GND | ×1档：输入≤3V / ×0.3档：输入≤10V / 仅限正电压输入 | H1跳线帽 / 插上：输入阻抗/断开：高阻输入 | 输入 | 衰减 | H2跳线帽 / 左：直通/右：衰减 | 缓冲输出
